# Altium schematic sheet Gain.SchDoc
size A4; DocumentNumber: 1; SheetNumber: 2; SheetTotal: 4
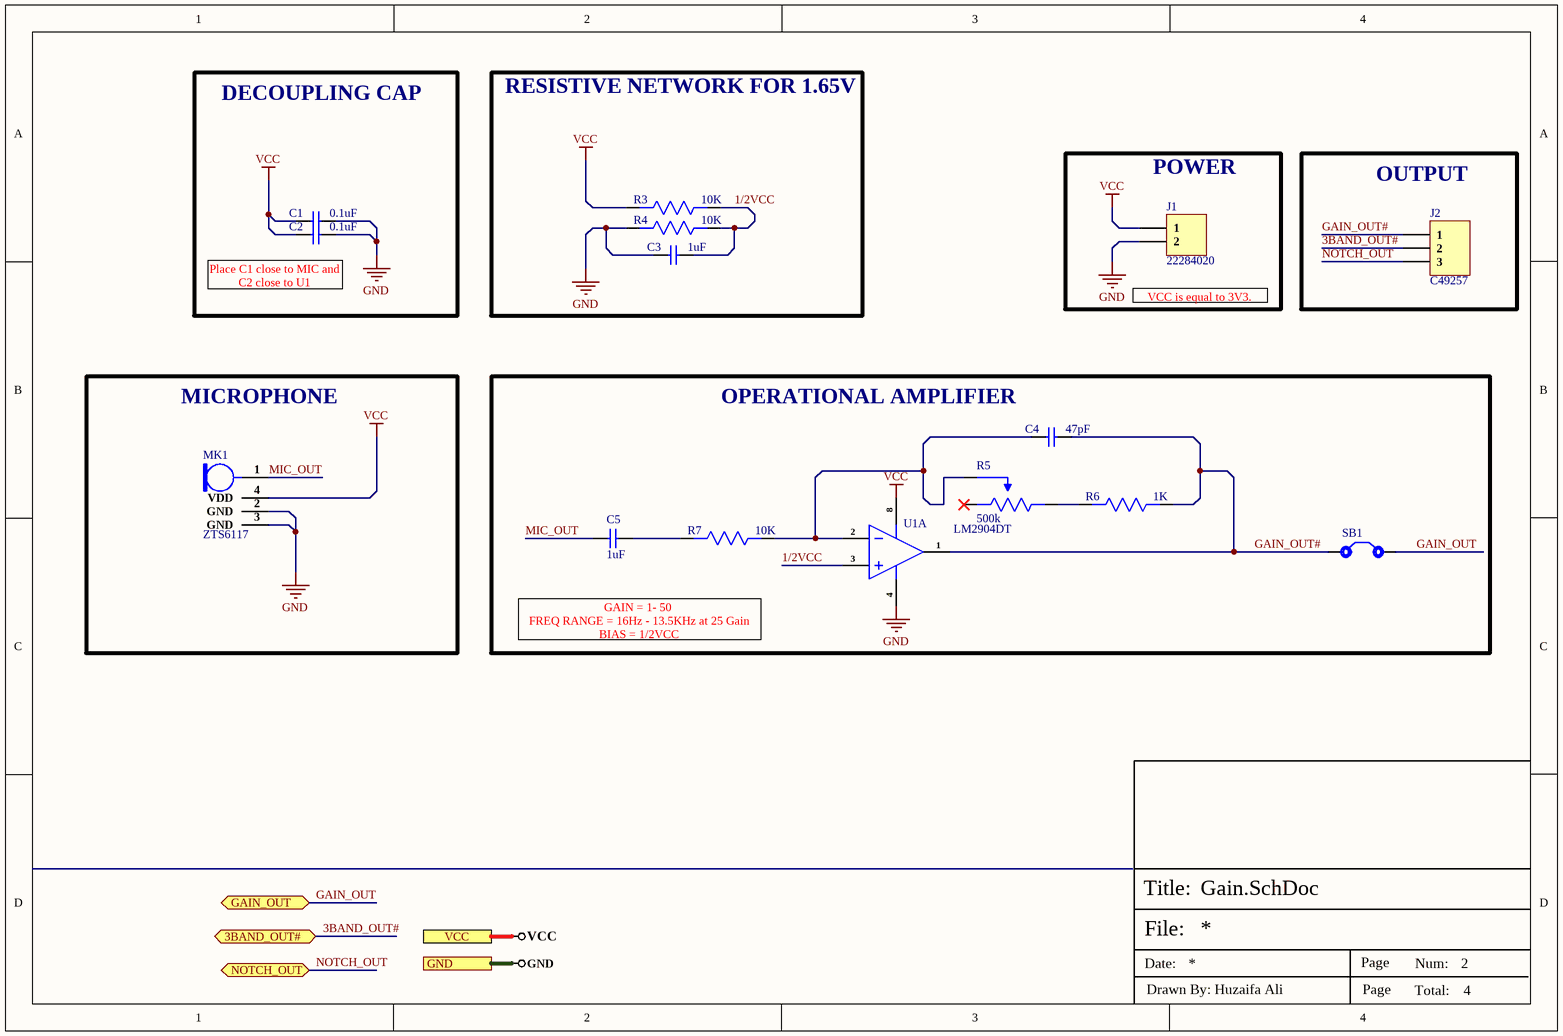
[diagram p0: Gain.SchDoc]

## Parts
C1  0.1uF  [CAP-0603]
C2  0.1uF  [CAP-0603]
C3  1uF  [Cap-0603]
C4  47pF  [Cap-0603]
C5  1uF  [Cap-0603]
J1  22284020  [HDR1X2_]
J2  C49257  [HDR1X3_]
MK1  ZTS6117  [ZTS6117_]
R3  10K  [Res-0603]
R4  10K  [Res-0603]
R5  500k  [VG039NCHXTB504_]
R6  1K  [Res-0603]
R7  10K  [Res-0603]
SB1  Solder Bridge  [Solder Bridge]  (value not drawn)
U1  LM2904DT  [SOIC-8]  (part A of 2)

## Blocks framed on the sheet
DECOUPLING CAP: C1 C2
RESISTIVE NETWORK FOR 1.65V: C3 R3 R4
POWER: J1
OUTPUT: J2
MICROPHONE: MK1
OPERATIONAL AMPLIFIER: C4 C5 R5-R7 SB1 U1

## Ports
3BAND_OUT# (bidir), GAIN_OUT (bidir), GND, NOTCH_OUT (bidir), VCC

## Nets
GND: C1.2 C2.2 C3.1 J1.2 MK1.2(GND) MK1.3(GND) R4.2 U1.4(VCC-) ; port GND
VCC: C1.1 C2.1 J1.1 MK1.4(VDD) R3.2 U1.8(VCC+) ; port VCC
1/2VCC: C3.2 R3.1 R4.1 U1.3(IN+)
3BAND_OUT#: J2.2 ; port 3BAND_OUT#
GAIN_OUT: SB1.2 ; port GAIN_OUT
GAIN_OUT#: C4.2 J2.1 R6.1 SB1.1 U1.1(1OUT)
MIC_OUT: C5.1 MK1.1(OUT)
NOTCH_OUT: J2.3 ; port NOTCH_OUT
NetC4_1: C4.1 R5.2(Wiper) R7.1 U1.2(IN-)
NetC5_2: C5.2 R7.2
NetR5_3: R5.3(CW) R6.2

Not connected (* = marked no-connect by the designer): R5 1(CCW)*

## Notes on the sheet
- Place C1 close to MIC and C2 close to U1
- (near J1) VCC is equal to 3V3.
- GAIN = 1- 50
  FREQ RANGE = 16Hz - 13.5KHz at 25 Gain
  BIAS = 1/2VCC
- File:
- Title:
- Date:
- Page
- Num:
- Total:
- Drawn By: Huzaifa Ali

## Library data of the parts
C1 C2 = CL10B104KB8NNNL: CAP CER 0.1UF 50V X7R 0603; Manufacturer: Samsung; Capacitance: 100nF; Tolerance: 10%; Supplier 1: Digi-Key; Manufacturer Part Number: CL10B104KB8NNNL; Stock 1: 3731229; Pricing 1: 1=0.1, 10=0.03, 50=0.0164, 100=0.0134, 500=0.00958, 1000=0.00753, 2500=0.00684, 5000=0.0063 (USD); Mount: Surface Mount; Case/Package: 0603; Min Operating Temperature: -55°C; Max Operating Temperature: 125°C; Dielectric: X7R; Packaging: Tape and Reel; Package Quantity: 15000; Voltage Rating: 50V; Voltage Rating (DC): 50V; Series: CL; Construction: Flat; Length: 1.6mm; Width: 0.031inch; Height: 0.8mm; Thickness: 0.035inch; Depth: 0.8mm; Radiation Hardening: No; RoHS Compliant: Yes; ComponentLink1URL: https://www.verical.com/server-webapp/html/getDatasheet?partID=357523&src-supplier=Verical; ComponentLink1Description: https://www.verical.com/server-webapp/html/getDatasheet?partID=357523&src-supplier=Verical; ComponentLink2URL: https://media.digikey.com/pdf/Data%20Sheets/Samsung%20PDFs/CL_Series_MLCC_ds.pdf?src-supplier=Digi-Key; ComponentLink2Description: https://media.digikey.com/pdf/Data%20Sheets/Samsung%20PDFs/CL_Series_MLCC_ds.pdf?src-supplier=Digi-Key; Supplier Part Number 1: 1276-CL10B104KB8NNNLCT-ND; LCSC Part Number: C913912
C3 C5 = UMK107AB7105KA-T: CAP CER 1UF 50V X7R 0603; Manufacturer: Taiyo Yuden; Tolerance: 10%; Item Type: Capacitor; ComponentLink1URL: http://www.farnell.com/datasheets/2048165.pdf?src-supplier=Element14; ComponentLink1Description: http://www.farnell.com/datasheets/2048165.pdf?src-supplier=Element14; ComponentLink2URL: https://www.murata.com/~/media/webrenewal/support/library/catalog/products/capacitor/mlcc/c02e.ashx?la=en-us&src-supplier=Digi-Key; ComponentLink2Description: https://www.murata.com/~/media/webrenewal/support/library/catalog/products/capacitor/mlcc/c02e.ashx?la=en-us&src-supplier=Digi-Key; Supplier 1: Digi-Key; Manufacturer Part Number: UMK107AB7105KA-T; Stock 1: 453098; Pricing 1: 1=0.28, 10=0.19, 100=0.1079, 500=0.0762, 1000=0.0667 (USD); Mount: Surface Mount; Case/Package: 0603; Case Code (Metric): 1608; Case Code (Imperial): 0603; Min Operating Temperature: -55°C; Max Operating Temperature: 125°C; Packaging: Tape and Reel; Package Quantity: 1; Capacitance: 1uF; Voltage Rating: 50V; Voltage Rating (DC): 50V; Dielectric: X7R; Termination: SMD/SMT; Length: 1.6mm; Height: 0.8mm; Width: 0.031inch; Thickness: 0.037inch; Depth: 0.8mm; Radiation Hardening: No; Halogen Free: Halogen Free; ComponentLink3URL: https://www.yuden.co.jp/productdata/catalog/mlcc_all_e.pdf?src-supplier=Digi-Key; ComponentLink3Description: https://www.yuden.co.jp/productdata/catalog/mlcc_all_e.pdf?src-supplier=Digi-Key; ComponentLink4URL: https://www.yuden.co.jp/productdata/catalog/mlcc_all_e.pdf?src-supplier=Onlinecomponents.com; ComponentLink4Description: https://www.yuden.co.jp/productdata/catalog/mlcc_all_e.pdf?src-supplier=Onlinecomponents.com; Supplier Part Number 1: 587-3247-1-ND; LCSC Part Number: C105174
C4 = AC0603JRNPO0BN470: CAP CER 47PF 100V NPO 0603; Manufacturer: Yageo; Zener Voltage: 33V; Tolerance: 6.06%; Max Power Dissipation: 250mW; Impedance: 80R; Item Type: Capacitor; Supplier 1: Digi-Key; Manufacturer Part Number: AC0603JRNPO0BN470; Stock 1: 4954; Pricing 1: 1=0.16, 10=0.115, 100=0.0542, 500=0.03798, 1000=0.03144 (USD); Mount: Surface Mount; Case/Package: TO-236-3; Case Code (Imperial): 0603; Case Code (Metric): 1608; Min Operating Temperature: -55°C; Max Operating Temperature: 125°C; Packaging: Tape and Reel; Capacitance: 47pF; Voltage Rating: 100V; Ratings: AEC-Q200; ComponentLink1URL: http://www.yageo.com/NewPortal/_en/search/productDocs.jsp?YageoPartNumber=AC0603JRNPO0BN470&src-supplier=Digi-Key; ComponentLink1Description: http://www.yageo.com/NewPortal/_en/search/productDocs.jsp?YageoPartNumber=AC0603JRNPO0BN470&src-supplier=Digi-Key; Supplier Part Number 1: 311-3086-1-ND; LCSC Part Number: C389107
J1 = 22284020: KK 254 Breakaway Header, Vertical, 2 Circuits, Tin (Sn) Plating, Mating Pin Length 6.09mm; Manufacturer: Molex; Number of Contacts: 2; Contact Resistance: 20mR; Max Voltage Rating (DC): 250V; Current Rating: 4A; Gender: Male; Connector Type: Male Pin; Pitch: 2.54mm; Glow Wire Compliant: Non-compliant; Supplier 1: Rs; Manufacturer Part Number: 22-28-4020; RoHS: Yes; Category: Headers and Wire Housings; Stock 1: 29550; Pricing 1: 50=0.06100, 150=0.05600, 250=0.05200, 500=0.04900 (GBP); Mount: Through Hole; Contact Plating: Tin; Color: Black; Contact Material: Brass,Bronze; Housing Color: Black; Housing Material: Nylon; Min Operating Temperature: 0°C; Max Operating Temperature: 75°C; Number of Rows: 1; Termination: Solder; Package Quantity: 1; Packaging: Bulk; Voltage Rating: 250V; Number of Positions: 2; Orientation: Straight; Number of Circuits: 2; Series: KK® 42375; Contact Type: Male Pin; Voltage Rating (DC): 250V; Max Voltage Rating (AC): 250V; Contact Mating Length: 0.24inch; Depth: 2.49mm; Radiation Hardening: No; Lead Free: Lead Free; RoHS Compliant: Yes; Flammability Rating: UL94 V-0; ComponentLink1URL: https://datasheet.ciiva.com/1433/1596842-1433683.pdf?src-supplier=Element14; ComponentLink1Description: https://datasheet.ciiva.com/1433/1596842-1433683.pdf?src-supplier=Element14; ComponentLink2URL: https://datasheet.ciiva.com/5157/0022284020-pcb-headers-228358-5157523.pdf?src-supplier=Mouser; ComponentLink2Description: https://datasheet.ciiva.com/5157/0022284020-pcb-headers-228358-5157523.pdf?src-supplier=Mouser; ComponentLink3URL: https://datasheet.ciiva.com/30153/214440022284020-pcb-headers-30153261.pdf?src-supplier=Onlinecomponents.com; ComponentLink3Description: https://datasheet.ciiva.com/30153/214440022284020-pcb-headers-30153261.pdf?src-supplier=Onlinecomponents.com; ComponentLink4URL: https://datasheet.ciiva.com/15217/getdatasheetpartid-127875-15217702.pdf?src-supplier=Verical; ComponentLink4Description: https://datasheet.ciiva.com/15217/getdatasheetpartid-127875-15217702.pdf?src-supplier=Verical; ComponentLink5URL: https://datasheet.ciiva.com/10088/0022284020-pcb-headers-10088332.pdf?src-supplier=Avnet; ComponentLink5Description: https://datasheet.ciiva.com/10088/0022284020-pcb-headers-10088332.pdf?src-supplier=Avnet; Supplier Part Number 1: 8967620; LCSC Part Number: C234182; Item Type: Header
J2 = C49257: 3A Straight Square Pins -40℃~+105℃ 3 2.54mm Black 1x3P Plugin,P=2.54mm Pin Headers ROHS; Manufacturer: BOOMELE; Item Type: Header; Manufacturer Part Number: C49257; LCSC Part Number: C49257; ComponentLink1Description: LCSC; ComponentLink1URL: https://www.lcsc.com/product-detail/Pin-Headers_BOOMELE-Boom-Precision-Elec-C49257_C49257.html
MK1 = ZTS6117: 1.5V~3.6V Omnidirectional 120uA -42dB 400Ω 59dB SMD-4P,1.9x2.8mm MEMS Microphones ROHS; Manufacturer: Zilltek; Manufacturer Part Number: ZTS6117; LCSC Part Number: C481300; Item Type: Microphone; ComponentLink1Description: LCSC; ComponentLink1URL: https://www.lcsc.com/product-detail/MEMS-Microphones_ZILLTEK-ZTS6117_C481300.html
R3 R4 R7 = RT0603BRD0710KL: RES SMD 10K OHM 0.1% 1/10W 0603; Manufacturer: Yageo; Power: 100mW; Rated Temperature: 70°C; Value: 10kR; Temperature Coefficient: 25ppm/°C; Working Voltage: 75V; Package Height: 0.45mm; Package Length: 1.6mm; Package Width: 0.8mm; Item Type: Resistor; Supplier 1: Rs; Manufacturer Part Number: RT0603BRD0710KL; RoHS: Yes; Category: Chip SMD Resistors; Stock 1: 20510; Pricing 1: 100=0.29800, 250=0.27800, 500=0.25900, 1000=0.23700 (GBP); Mounting Technology: Surface Mount; Pins: 2; Case/Package: 0603; Min Operating Temperature: -55°C; Max Operating Temperature: 155°C; Tolerance: 0.1%; Resistor Type: FIXED RESISTOR; Construction: Chip; Package Style: SMTMeter; Packaging: Tape and Reel; Technology: THIN FILM; Termination: Wraparound; Reach SVHC Compliant: Yes; RoHS Compliant: Yes; ComponentLink1URL: https://datasheet.ciiva.com:443/pdfs/VipMasterIC/IC/YAGO/YAGO-S-A0008510989/YAGO-S-A0008510989-1.pdf?src-supplier=IHS+Markit; ComponentLink1Description: https://datasheet.ciiva.com:443/pdfs/VipMasterIC/IC/YAGO/YAGO-S-A0008510989/YAGO-S-A0008510989-1.pdf?src-supplier=IHS+Markit; ComponentLink2URL: https://datasheet.ciiva.com/5624/pyu-rt-1-to-0-05-rohs-l-4-5624351.pdf?src-supplier=Mouser; ComponentLink2Description: https://datasheet.ciiva.com/5624/pyu-rt-1-to-0-05-rohs-l-4-5624351.pdf?src-supplier=Mouser; ComponentLink3URL: https://datasheet.ciiva.com/29721/pyu-rt-1-to-0-05-rohs-l-4-29721177.pdf?src-supplier=Digi-Key; ComponentLink3Description: https://datasheet.ciiva.com/29721/pyu-rt-1-to-0-05-rohs-l-4-29721177.pdf?src-supplier=Digi-Key; Supplier Part Number 1: 1991391P; LCSC Part Number: C95204
R5 = VG039NCHXTB504: ±25% 500kΩ SMD Variable Resistors/Potentiometers ROHS; Manufacturer: HDK; Manufacturer Part Number: VG039NCHXTB504; LCSC Part Number: C128558; Item Type: Potentiometer; ComponentLink1Description: LCSC; ComponentLink1URL: https://www.lcsc.com/product-detail/Variable-Resistors-Potentiometers_HDK-Hokuriku-Elec-Industry-VG039NCHXTB504_C128558.html; Value: 500k
R6 = RT0603BRD071KL: RES SMD 1K OHM 0.1% 1/10W 0603; Manufacturer: Yageo; Resistance: 1kR; Power Rating: 100mW; Voltage Rating: 75V; Temperature Coefficient: 25ppm/°C; Voltage Rating (DC): 50V; Item Type: Resistor; Supplier 1: Arrow Electronics; Manufacturer Part Number: RT0603BRD071KL; RoHS: Yes; Category: Chip SMD Resistors; Stock 1: 130000; Pricing 1: 5000=0.03900, 10000=0.03450, 25000=0.03070, 50000=0.02040 (USD); Mount: Surface Mount; Case/Package: 0603; Case Code (Metric): 1608; Case Code (Imperial): 0603; Contact Plating: Tin,Lead; Size Code: 0603; Min Operating Temperature: -55°C; Max Operating Temperature: 125°C; Package Quantity: 5000; Packaging: Tape and Reel; Resistor Type: Thin Film; Number of Terminations: 2; Termination: SMD/SMT; Max Power Dissipation: 100mW; Features: Moisture Resistant; Series: RT; Technology: THIN FILM; Construction: Rectangular; Length: 1.6mm; Width: 0.031inch; Height: 0.022inch; Depth: 0.8mm; Military Standard: Not; Lead Free: Lead Free; RoHS Compliant: Yes; ComponentLink1URL: https://datasheet.ciiva.com/11819/0900766b8079c86e-11819652.pdf?src-supplier=RSComponents; ComponentLink1Description: https://datasheet.ciiva.com/11819/0900766b8079c86e-11819652.pdf?src-supplier=RSComponents; ComponentLink2URL: https://datasheet.ciiva.com/5624/pyu-rt-1-to-0-05-rohs-l-4-5624759.pdf?src-supplier=Mouser; ComponentLink2Description: https://datasheet.ciiva.com/5624/pyu-rt-1-to-0-05-rohs-l-4-5624759.pdf?src-supplier=Mouser; ComponentLink3URL: https://datasheet.ciiva.com/29718/pyu-rt-1-to-0-05-rohs-l-4-29718010.pdf?src-supplier=Digi-Key; ComponentLink3Description: https://datasheet.ciiva.com/29718/pyu-rt-1-to-0-05-rohs-l-4-29718010.pdf?src-supplier=Digi-Key; ComponentLink4URL: https://datasheet.ciiva.com/29718/pyu-rt-1-to-0-05-rohs-l-4-29718011.pdf?src-supplier=Digi-Key; ComponentLink4Description: https://datasheet.ciiva.com/29718/pyu-rt-1-to-0-05-rohs-l-4-29718011.pdf?src-supplier=Digi-Key; Supplier Part Number 1: RT0603BRD071KL; LCSC Part Number: C110776
SB1 = Solder Bridge: Solder Bridge ON; Manufacturer Part Number: Solder Bridge; Item Type: Solder Bridge
U1 = LM2904DT: General Purpose Amplifier 2 Circuit  8-SO; Manufacturer: STMicroelectronics; Number of Terminals/Pins: 8; Package Body Material: Plastic; Number of Channels: 2; Bandwidth: 1.1MHz; Max Supply Voltage: 30V; Min Supply Voltage: 3V; Min Dual Supply Voltage: 1.5V; Max Dual Supply Voltage: 15V; Voltage Gain: 100dB; Output Current: 40mA; Slew Rate: 0.6V/µs; Nominal Supply Current: 1.2mA; Common Mode Rejection Ratio: 70dB; Input Offset Voltage (Vos): 7mV; Input Bias Current: 150nA; Operating Supply Current: 700uA; Dual Supply Voltage: 9V; Max Supply Current: 32mA; Time @ Peak Reflow Temperature-Max (s): 40s; Item Type: IC; Supplier 1: Mouser; Manufacturer Part Number: LM2904DT; RoHS: Yes; Category: Amplifiers - Op Amps, Buffer, Instrumentation; Stock 1: 104539; Pricing 1: 1=0.44000, 10=0.34900, 50=0.34900, 100=0.25900, 1000=0.17000, 10000=0.15000 (USD); Mount: Surface Mount; Case/Package: SOIC; Number of Pins: 8; Contact Plating: Gold; Weight: 0.01lb; Package Shape: Rectangular; Terminal Finish: Nickel; Min Operating Temperature: -40°C; Max Operating Temperature: 125°C; Packaging: Tape and Reel; Gain Bandwidth Product: 1.1MHz; Number of Circuits: 2; Package Quantity: 2500; Operating Supply Voltage: 15V; Supply Current: 1.2mA; Technology: BIPOLAR; Series: -; Output Current per Channel: 40mA; Number of Elements: 2; Number of Amplifiers: 2; Amplifier Type: GENERAL PURPOSE; Unity Gain Bandwidth Product: 1.1MHz; Number of Functions: 2; Terminal Form: Gull Wing; Terminal Position: DUAL; Moisture Sensitivity Level: 1; JESD-30 Code: R-PDSO-G8; Surface Mount: Yes; Peak Reflow Temperature (Cel): 260°C; Input Offset Voltage-Max: 7mV; Slew Rate-Nom: 0.6V/µs; Length: 4.9mm; Width: 3.9mm; Height: 1.25mm; Radiation Hardening: No; Reach SVHC Compliant: Yes; Lead Free: Contains Lead; RoHS Compliant: Yes; Temperature Grade: AUTOMOTIVE; ComponentLink1URL: https://datasheet.ciiva.com/5703/1802155-5703335.pdf?src-supplier=Farnell; ComponentLink1Description: https://datasheet.ciiva.com/5703/1802155-5703335.pdf?src-supplier=Farnell; ComponentLink2URL: https://datasheet.ciiva.com/27055/1993227-27055857.pdf?src-supplier=Jameco; ComponentLink2Description: https://datasheet.ciiva.com/27055/1993227-27055857.pdf?src-supplier=Jameco; ComponentLink3URL: https://datasheet.ciiva.com/15129/getdatasheetpartid-32489-15129656.pdf?src-supplier=Verical; ComponentLink3Description: https://datasheet.ciiva.com/15129/getdatasheetpartid-32489-15129656.pdf?src-supplier=Verical; ComponentLink4URL: https://datasheet.ciiva.com/41459/001185000-da-01-en-ic-op-amp-low-pwr-du-lm2904dt-soic-8-stm-41459659.pdf?src-supplier=Conrad; ComponentLink4Description: https://datasheet.ciiva.com/41459/001185000-da-01-en-ic-op-amp-low-pwr-du-lm2904dt-soic-8-stm-41459659.pdf?src-supplier=Conrad; ComponentLink5URL: https://datasheet.ciiva.com/1795/cd00000535-1795476.pdf?src-supplier=Digi-Key; ComponentLink5Description: https://datasheet.ciiva.com/1795/cd00000535-1795476.pdf?src-supplier=Digi-Key; ComponentLink6URL: https://datasheet.ciiva.com/1795/cd00000535-1795475.pdf?src-supplier=Digi-Key; ComponentLink6Description: https://datasheet.ciiva.com/1795/cd00000535-1795475.pdf?src-supplier=Digi-Key; ComponentLink7URL: https://datasheet.ciiva.com/1795/cd00000535-1795477.pdf?src-supplier=Digi-Key; ComponentLink7Description: https://datasheet.ciiva.com/1795/cd00000535-1795477.pdf?src-supplier=Digi-Key; ComponentLink8URL: https://datasheet.ciiva.com/16200/cd00000535-16200605.pdf?src-supplier=Future+Electronics; ComponentLink8Description: https://datasheet.ciiva.com/16200/cd00000535-16200605.pdf?src-supplier=Future+Electronics; Supplier Part Number 1: 511-LM2904DT; LCSC Part Number: C105411